# Altium project Optical Sensor_.PrjPcb
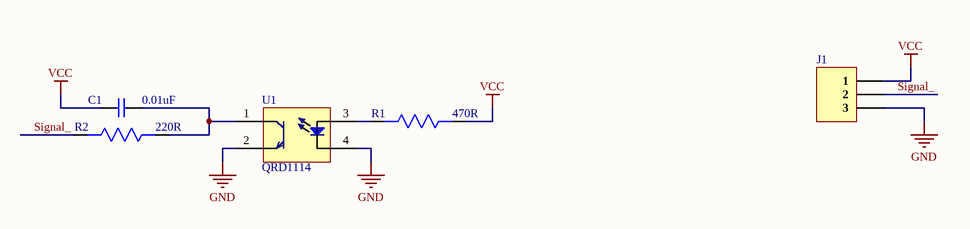
[diagram p0: Main_Sheet.SchDoc]
1 sheet, 5 parts. Net scope: global (net labels, ports and power ports of the same name join across sheets).
Board file: Optical_Sensor.PcbDoc

## Sheet Main_Sheet.SchDoc
size A4

### Parts
C1  0.01uF  [Cap 0201]
J1  B3B-XH-A(LF)(SN)  [B3B-XH-A(LF)(SN)]  (value not drawn)
R1  470R  [Res-0201]
R2  220R  [Res-0201]
U1  QRD1114  [QRD1114]

### Nets
GND: J1.3 U1.2(E) U1.4(Ca)
VCC: C1.1 J1.1 R1.1
Signal_: J1.2 R2.2
NetC1_2: C1.2 R2.1 U1.1(C)
NetR1_2: R1.2 U1.3(An)

### Library data of the parts
C1 = GRM033R61C103KA12D: CAP CER 10000PF 16V X5R 0201; Manufacturer: Murata; Capacitance: 10nF; Tolerance: 10%; Supplier 1: Digi-Key; Manufacturer Part Number: GRM033R61C103KA12D; RoHS: Yes; Category: Ceramic Capacitors; Stock 1: 492163; Pricing 1: 1=0.10000, 10=0.01700, 50=0.00920, 100=0.00750, 500=0.00540, 1000=0.00424, 2500=0.00385, 5000=0.00354 (USD); Mount: Surface Mount; Case/Package: 0201; Case Code (Imperial): 0201; Case Code (Metric): 0603; Weight: 1.2E-05oz; Min Operating Temperature: -55°C; Max Operating Temperature: 85°C; Voltage Rating (DC): 16V; Packaging: Tape and Reel; Package Quantity: 1; Voltage Rating: 16V; Dielectric: X5R; Termination: SMD/SMT; Length: 0.024inch; Width: 0.3mm; Height: 0.3mm; Thickness: 0.013inch; Lead Free: Lead Free; ComponentLink1URL: https://datasheet.ciiva.com/18700/grm033r61c103ka12-01-18700237.pdf?src-supplier=Digi-Key; ComponentLink1Description: https://datasheet.ciiva.com/18700/grm033r61c103ka12-01-18700237.pdf?src-supplier=Digi-Key; ComponentLink2URL: https://datasheet.ciiva.com/24221/c02e-24221098.pdf?src-supplier=Mouser; ComponentLink2Description: https://datasheet.ciiva.com/24221/c02e-24221098.pdf?src-supplier=Mouser; ComponentLink3URL: https://datasheet.ciiva.com/18700/partnumbering-e-01-18700238.pdf?src-supplier=Digi-Key; ComponentLink3Description: https://datasheet.ciiva.com/18700/partnumbering-e-01-18700238.pdf?src-supplier=Digi-Key; ComponentLink4URL: https://datasheet.ciiva.com/18700/partnumbering-e-01-18700239.pdf?src-supplier=Digi-Key; ComponentLink4Description: https://datasheet.ciiva.com/18700/partnumbering-e-01-18700239.pdf?src-supplier=Digi-Key; Supplier Part Number 1: 490-7223-1-ND
J1 = B3B-XH-A(LF)(SN): CONN HEADER VERT 3POS 2.5MM; Manufacturer: JST; Current Rating: 3A; Number of Positions: 3; Connector Type: Male Pin; Voltage Rating (AC): 250V; Contact Resistance: 20mR; Insulation Resistance: 1GR; Gender: Male; Wire/Cable Gauge: 22AWG; Supplier 1: Farnell; Manufacturer Part Number: B3B-XH-A(LF)(SN); RoHS: Yes; Category: Headers and Wire Housings; Stock 1: 114254; Pricing 1: 100=0.09250, 500=0.07700, 1000=0.06470, 2500=0.06340, 5000=0.06210, 10000=0.06080 (GBP); Mount: Through Hole; Contact Plating: Tin,Lead,Copper; Contact Material: Brass; Color: Natural; Housing Color: White; Housing Material: Polyamide; Min Operating Temperature: -25°C; Max Operating Temperature: 85°C; Number of Rows: 1; Packaging: Bulk; Termination: Press-Fit; Max Current Rating: 3A; Voltage Rating: 250V; Fastening Type: Detent; Number of Contacts: 3; Max Voltage Rating (AC): 250V; Max Voltage Rating (DC): 250V; Orientation: Straight; Length: 9.9mm; Pitch: 2.5mm; Lead Pitch: 2.5mm; Depth: 5.75mm; Lead Free: Lead Free; REACH SVHC: No SVHC; ComponentLink1URL: https://datasheet.ciiva.com/26894/getdatasheetpartid-640434-26894454.pdf?src-supplier=Verical; ComponentLink1Description: https://datasheet.ciiva.com/26894/getdatasheetpartid-640434-26894454.pdf?src-supplier=Verical; ComponentLink2URL: https://datasheet.ciiva.com/11746/0900766b8082653f-11746520.pdf?src-supplier=RSComponents; ComponentLink2Description: https://datasheet.ciiva.com/11746/0900766b8082653f-11746520.pdf?src-supplier=RSComponents; ComponentLink3URL: https://datasheet.ciiva.com/26894/getdatasheetpartid-440399-26894778.pdf?src-supplier=Verical; ComponentLink3Description: https://datasheet.ciiva.com/26894/getdatasheetpartid-440399-26894778.pdf?src-supplier=Verical; Supplier Part Number 1: 1516277
R1 = RC0201JR-07470RL: Res Thick Film 0201 470 Ohm 5% 0.05W(1/20W) ±200ppm/C Molded SMD Paper T/R; Manufacturer: Yageo; Temperature Coefficient: 200ppm/°C; Voltage Rating (DC): 25V; Max Power Dissipation: 50mW; Supplier 1: Digi-Key; Manufacturer Part Number: RC0201JR-07470RL; RoHS: Yes; Category: Chip SMD Resistors; Stock 1: 173754; Pricing 1: 1=0.10000, 10=0.02600, 100=0.01040, 1000=0.00466, 2500=0.00405, 5000=0.00334 (USD); Case/Package: 0201; Number of Pins: 2; Contact Plating: Tin,Matte; Case Code (Metric): 0603; Case Code (Imperial): 0201; Min Operating Temperature: -55°C; Max Operating Temperature: 125°C; Resistor Type: Thick Film; Tolerance: 5%; Resistance: 470R; Number of Terminations: 2; Termination: SMD/SMT; Features: Moisture Resistant; Power Rating: 50mW; Voltage Rating: 25V; Package Quantity: 1; Packaging: Tape and Reel; Length: 0.6mm; Width: 0.3mm; Height: 0.01inch; Depth: 0.3mm; Radiation Hardening: No; Military Standard: Not; Lead Free: Lead Free; REACH SVHC: No SVHC; ComponentLink1URL: https://datasheet.ciiva.com/5924/443682-5924928.pdf?src-supplier=Farnell; ComponentLink1Description: https://datasheet.ciiva.com/5924/443682-5924928.pdf?src-supplier=Farnell; ComponentLink2URL: https://datasheet.ciiva.com/8885/pyu-rc0201-51-rohs-l-8-8885600.pdf?src-supplier=Avnet; ComponentLink2Description: https://datasheet.ciiva.com/8885/pyu-rc0201-51-rohs-l-8-8885600.pdf?src-supplier=Avnet; ComponentLink3URL: https://datasheet.ciiva.com/28390/pyu-rc0201-51-rohs-l-8-28390376.pdf?src-supplier=Avnet+Europe; ComponentLink3Description: https://datasheet.ciiva.com/28390/pyu-rc0201-51-rohs-l-8-28390376.pdf?src-supplier=Avnet+Europe; ComponentLink4URL: https://datasheet.ciiva.com/8885/pyu-rc0201-51-rohs-l-8-8885642.pdf?src-supplier=Avnet; ComponentLink4Description: https://datasheet.ciiva.com/8885/pyu-rc0201-51-rohs-l-8-8885642.pdf?src-supplier=Avnet; ComponentLink5URL: https://datasheet.ciiva.com/2462/pyu-r-int-thick-7-2462802.pdf?src-supplier=Digi-Key; ComponentLink5Description: https://datasheet.ciiva.com/2462/pyu-r-int-thick-7-2462802.pdf?src-supplier=Digi-Key; ComponentLink6URL: https://datasheet.ciiva.com/2462/pyu-r-int-thick-7-2462803.pdf?src-supplier=Digi-Key; ComponentLink6Description: https://datasheet.ciiva.com/2462/pyu-r-int-thick-7-2462803.pdf?src-supplier=Digi-Key; ComponentLink7URL: https://datasheet.ciiva.com/2462/pyu-r-int-thick-7-2462804.pdf?src-supplier=Digi-Key; ComponentLink7Description: https://datasheet.ciiva.com/2462/pyu-r-int-thick-7-2462804.pdf?src-supplier=Digi-Key; Supplier Part Number 1: 311-470NCT-ND
R2 = RC0201FR-07220RL: Res Thick Film 0201 220 Ohm 1% 1/20W ±200ppm/°C Molded SMD SMD Paper T/R; Manufacturer: Yageo; Power Rating: 50mW; Voltage Rating: 25V; Supplier 1: Digi-Key; Manufacturer Part Number: RC0201FR-07220RL; RoHS: Yes; Category: Chip SMD Resistors; Stock 1: 189347; Pricing 1: 1=0.10000, 10=0.03600, 100=0.01480, 1000=0.00665, 2500=0.00577, 5000=0.00477 (USD); Case/Package: 0201; Contact Plating: Tin,Matte; Case Code (Imperial): 0201; Case Code (Metric): 0603; Min Operating Temperature: -55°C; Max Operating Temperature: 125°C; Resistance: 220R; Tolerance: 1%; Temperature Coefficient: 200ppm/°C; Resistor Type: Thick Film; Packaging: Tape and Reel; Features: Moisture Resistant; Max Power Dissipation: 50mW; Number of Terminations: 2; Termination: SMD/SMT; Length: 0.6mm; Width: 0.012inch; Height: 0.01inch; Depth: 0.3mm; Radiation Hardening: No; REACH SVHC: Unknown; Military Standard: Not; ComponentLink1URL: https://datasheet.ciiva.com/7672/1563626-7672213.pdf?src-supplier=Element14; ComponentLink1Description: https://datasheet.ciiva.com/7672/1563626-7672213.pdf?src-supplier=Element14; ComponentLink2URL: https://datasheet.ciiva.com/8886/pyu-rc0201-51-rohs-l-8-8886758.pdf?src-supplier=Avnet; ComponentLink2Description: https://datasheet.ciiva.com/8886/pyu-rc0201-51-rohs-l-8-8886758.pdf?src-supplier=Avnet; ComponentLink3URL: https://datasheet.ciiva.com/16855/pyu-rc0201-51-rohs-l-8-16855847.pdf?src-supplier=Avnet+Europe; ComponentLink3Description: https://datasheet.ciiva.com/16855/pyu-rc0201-51-rohs-l-8-16855847.pdf?src-supplier=Avnet+Europe; ComponentLink4URL: https://datasheet.ciiva.com/28393/pyu-rc0201-51-rohs-l-8-28393063.pdf?src-supplier=Avnet+Europe; ComponentLink4Description: https://datasheet.ciiva.com/28393/pyu-rc0201-51-rohs-l-8-28393063.pdf?src-supplier=Avnet+Europe; Supplier Part Number 1: YAG2509CT-ND
U1 = QRD1114: QRD1114 Series 30 V 50 mA Phototransistor Reflective Object Sensor; Manufacturer: ON Semiconductor / Fairchild; Wavelength: 940nm; Forward Current: 50mA; Rise Time: 10000ns; Forward Voltage: 1.7V; Sensing Distance: 1.27mm; Collector Emitter Voltage (VCEO): 30V; Max Collector Current: 1mA; Fall Time: 50000ns; Number of Channels: 1; Reverse Breakdown Voltage: 5V; Response Time: 50us; Power Dissipation: 100mW; Input Current: 20mA; Supplier 1: Digi-Key; Manufacturer Part Number: QRD1114; RoHS: Yes; Category: Optocouplers; Stock 1: 4356; Pricing 1: 1=1.64000, 5=1.58000, 10=1.28400, 25=1.10600, 50=0.95780, 100=0.86900, 500=0.73076, 1000=0.65175, 5000=0.59250 (USD); Mount: Through Hole; Number of Pins: 4; Weight: 0g; Contact Plating: Tin,Matte; Min Operating Temperature: -40°C; Max Operating Temperature: 85°C; Packaging: Bulk; Package Quantity: 100; Output Type: Phototransistor; Reverse Voltage (DC): 5V; Collector Emitter Breakdown Voltage: 30V; Number of Elements: 1; Operating Supply Voltage: 1.7V; Max Power Dissipation: 100mW; Length: 6.1mm; Width: 4.39mm; Height: 4.65mm; Radiation Hardening: No; Lead Free: Lead Free; REACH SVHC: No SVHC; ComponentLink1URL: https://datasheet.ciiva.com/12069/qrd1114-192054-12069087.pdf?src-supplier=Mouser; ComponentLink1Description: https://datasheet.ciiva.com/12069/qrd1114-192054-12069087.pdf?src-supplier=Mouser; ComponentLink2URL: https://datasheet.ciiva.com/19453/874939-19453556.pdf?src-supplier=Jameco; ComponentLink2Description: https://datasheet.ciiva.com/19453/874939-19453556.pdf?src-supplier=Jameco; ComponentLink3URL: https://datasheet.ciiva.com/2823/qrd1113-2823879.pdf?src-supplier=Digi-Key; ComponentLink3Description: https://datasheet.ciiva.com/2823/qrd1113-2823879.pdf?src-supplier=Digi-Key; ComponentLink4URL: https://datasheet.ciiva.com/26165/qrd1113-26165833.pdf?src-supplier=Avnet+Europe; ComponentLink4Description: https://datasheet.ciiva.com/26165/qrd1113-26165833.pdf?src-supplier=Avnet+Europe; ComponentLink5URL: https://datasheet.ciiva.com/3305/qrd1113-3305733.pdf?src-supplier=Avnet; ComponentLink5Description: https://datasheet.ciiva.com/3305/qrd1113-3305733.pdf?src-supplier=Avnet; ComponentLink6URL: https://datasheet.ciiva.com/17088/qrd1113-17088344.pdf?src-supplier=Future+Electronics; ComponentLink6Description: https://datasheet.ciiva.com/17088/qrd1113-17088344.pdf?src-supplier=Future+Electronics; Supplier Part Number 1: QRD1114-ND